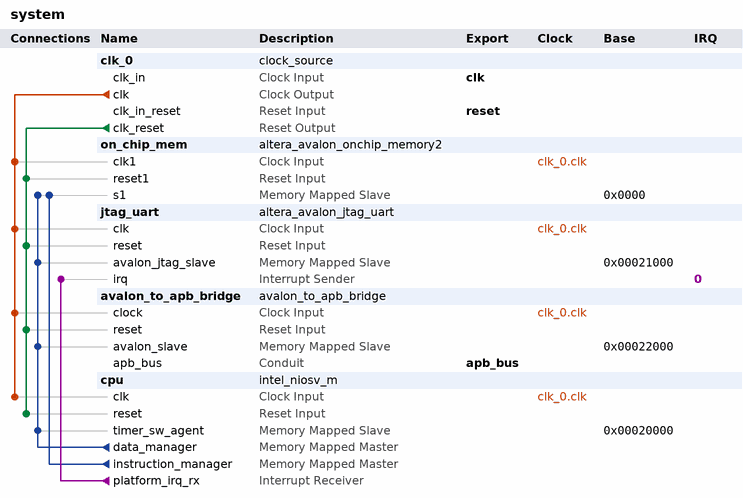
[diagram p0: system contents]
# Platform Designer (Qsys) system system, Cyclone IV E EP4CE115F29C7
# Parameters at their usual value, and those the tool derives, are not listed.
package require -exact qsys 25.1
create_system system
set_project_property DEVICE_FAMILY {Cyclone IV E}
set_project_property DEVICE EP4CE115F29C7

add_instance clk_0 clock_source 25.1
set_instance_parameter_value clk_0 clockFrequency 50000000

add_instance on_chip_mem altera_avalon_onchip_memory2 25.1
set_instance_parameter_value on_chip_mem dataWidth 32
set_instance_parameter_value on_chip_mem dualPort false
set_instance_parameter_value on_chip_mem initMemContent true
set_instance_parameter_value on_chip_mem initializationFileName onchip_mem.hex
set_instance_parameter_value on_chip_mem memorySize 40960

add_instance jtag_uart altera_avalon_jtag_uart 25.1
set_instance_parameter_value jtag_uart simInteractiveOptions NO_INTERACTIVE_WINDOWS

add_instance avalon_to_apb_bridge avalon_to_apb_bridge 1.0

add_instance cpu intel_niosv_m 26.0.0
set_instance_parameter_value cpu enableAvalonInterface false
set_instance_parameter_value cpu enableDebug false
set_instance_parameter_value cpu enableDebugReset false
set_instance_parameter_value cpu enableECCFull false
set_instance_parameter_value cpu enableECCLite false
set_instance_parameter_value cpu hartId 0
set_instance_parameter_value cpu interruptMode 0
set_instance_parameter_value cpu pipelineArch true
set_instance_parameter_value cpu resetSlave on_chip_mem.s1

# connections
add_connection clk_0.clk avalon_to_apb_bridge.clock clock
add_connection clk_0.clk cpu.clk clock
add_connection clk_0.clk jtag_uart.clk clock
add_connection clk_0.clk on_chip_mem.clk1 clock
add_connection clk_0.clk_reset avalon_to_apb_bridge.reset reset
add_connection clk_0.clk_reset cpu.reset reset
add_connection clk_0.clk_reset jtag_uart.reset reset
add_connection clk_0.clk_reset on_chip_mem.reset1 reset
add_connection cpu.data_manager avalon_to_apb_bridge.avalon_slave avalon
set_connection_parameter_value cpu.data_manager/avalon_to_apb_bridge.avalon_slave baseAddress 0x00022000
add_connection cpu.data_manager cpu.timer_sw_agent avalon
set_connection_parameter_value cpu.data_manager/cpu.timer_sw_agent baseAddress 0x00020000
add_connection cpu.data_manager jtag_uart.avalon_jtag_slave avalon
set_connection_parameter_value cpu.data_manager/jtag_uart.avalon_jtag_slave baseAddress 0x00021000
add_connection cpu.data_manager on_chip_mem.s1 avalon
set_connection_parameter_value cpu.data_manager/on_chip_mem.s1 baseAddress 0x0000
add_connection cpu.instruction_manager on_chip_mem.s1 avalon
set_connection_parameter_value cpu.instruction_manager/on_chip_mem.s1 baseAddress 0x0000
add_connection cpu.platform_irq_rx jtag_uart.irq interrupt
set_connection_parameter_value cpu.platform_irq_rx/jtag_uart.irq irqNumber 0

# exported interfaces
add_interface apb_bus conduit end
set_interface_property apb_bus EXPORT_OF avalon_to_apb_bridge.apb_bus
add_interface clk clock sink
set_interface_property clk EXPORT_OF clk_0.clk_in
add_interface reset reset sink
set_interface_property reset EXPORT_OF clk_0.clk_in_reset

set_interconnect_requirement {$system} qsys_mm.clockCrossingAdapter HANDSHAKE
set_interconnect_requirement {$system} qsys_mm.enableEccProtection FALSE
set_interconnect_requirement {$system} qsys_mm.insertDefaultSlave FALSE
set_interconnect_requirement {$system} qsys_mm.maxAdditionalLatency 1

save_system system.qsys
